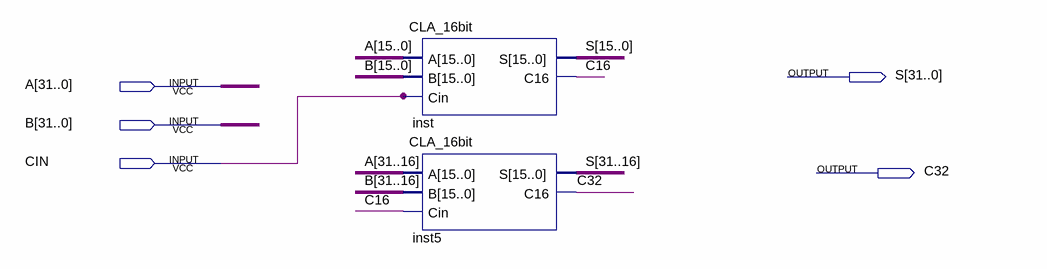
[diagram p0: schematic sheet]
// Quartus schematic Adder_32bit.bdf as structural Verilog: 2 symbols, 5 pins
module Adder_32bit (
  input  [31:0] A,
  input  [31:0] B,
  input  CIN,
  output [31:0] S,
  output C32
);

  wire C16;

  CLA_16bit inst (.A(A[15:0]), .B(B[15:0]), .Cin(CIN), .S(S[15:0]), .C16(C16));
  CLA_16bit inst5 (.A(A[31:16]), .B(B[31:16]), .Cin(C16), .S(S[31:16]), .C16(C32));
endmodule
